# Altium project lga1700.PrjPCB (part 1 of 11)
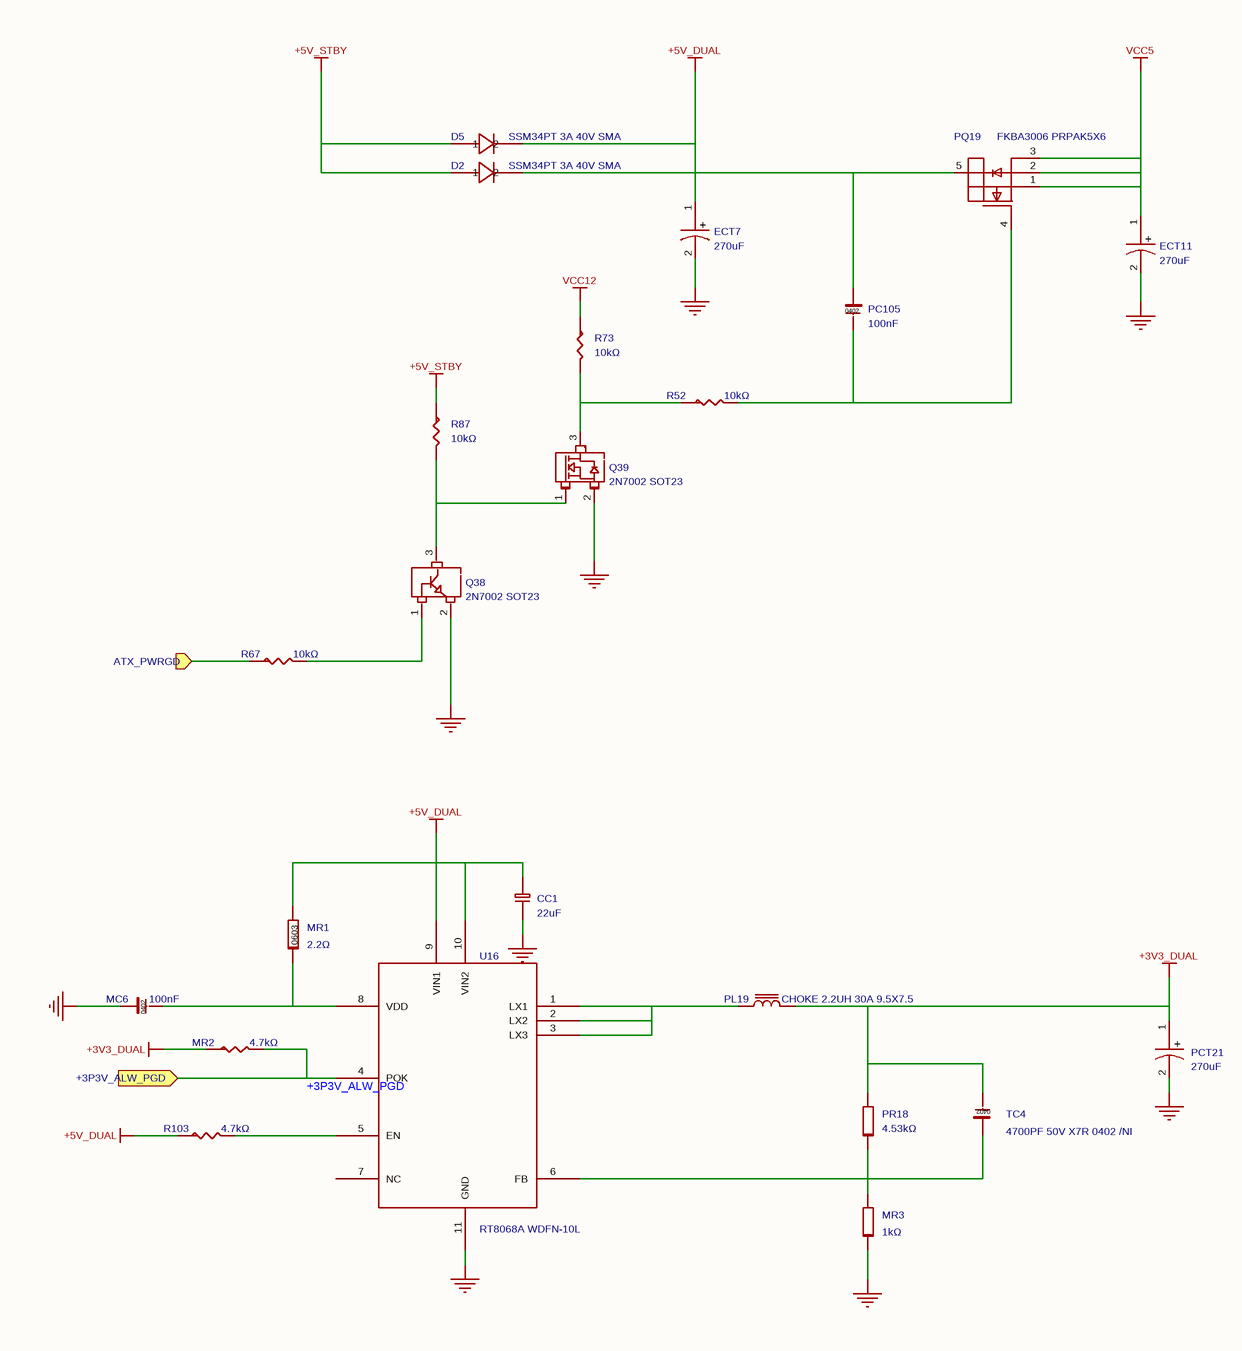
[diagram p0: 5V_DUAL.schdoc]
26 sheets, 863 parts. Net scope: flat (ports and power ports of the same name join across sheets).
Board files: lga1700.pcbdoc, lga1700ascii.pcbdoc
Sheets:
  5V_DUAL.schdoc
  ADL S PCH 600 CLOCK_PCIE.schdoc
  ADL S PCH 600 PWR.schdoc
  ADL S PCH 600 SPI_PM.schdoc
  ADL S PCH 600 STRAP.schdoc
  AUDIO - ALC897_3CH.schdoc
  COM.schdoc
  CPU_PWR - +VCCCORE_1_3.schdoc
  CPU_PWR - +VCCCORE_2_3.schdoc
  CPU_PWR - +VCCCORE_3_3.schdoc
  CPU_PWR - +VCCGT.schdoc
  CPU_PWR - 1.8V_1.05V.schdoc
  CPU_PWR - VCCIN_AUX.schdoc
  DDR4_PWR - +VDDQ_+VTT_+VPP.schdoc
  DDR4_UDIMM CHANNEL-A0.schdoc
  DDR4_UDIMM CHANNEL-B0.schdoc
  DISPLAY - HDMI 2.0.schdoc
  LAN - RTL8111H.schdoc
  M.2_SATA_SLOT.schdoc
  PCH_PWR - 0.82V_1.05V_1.8V.schdoc
  PEG_PCIEX1 SLOT.schdoc
  POWER - SYSTEM POWER.schdoc
  SIO - IT8613E.schdoc
  SIO - IT8784E.schdoc
  USB32 GEN1 5G_FRONT.schdoc
  USB32 GEN1 5G_REAR.schdoc

## Sheet 5V_DUAL.schdoc
size 420 x 297 mm; Symbol: Sheet-Symbol_A2; Company: 嘉立创EDA; Version: V1.0; Page Size: A2; @Project Name: 【全网首发】X86电脑主板_copy; @Page Count: 30; @Update Date: 2025-10-09; @Create Date: 2025-10-09; @Schematic Name: SCHEMATIC1_1; @Page No: 0; @Page Name: 5V_DUAL; Device: Sheet-Symbol_A2; Border: 1; Width: 1655; Height: 1170; Region Start: 1; X Region Count: 6; Y Region Count: 4; Blade Width: 10; Title Block Position: 3

### Parts
CC1  22uF  [C0603_2]
D2  value SSM34PT 3A 40V SMA  [DIODE_1N5817_4148]  (hidden comment: SS34)
D5  value SSM34PT 3A 40V SMA  [DIODE_1N5817_4148]  (hidden comment: SS34)
ECT7  270uF  [EC1P25C_2]
ECT11  270uF  [EC1P25C_2]
MC6  100nF  [C0402_1]
MR1  2.2Ω  [R0603_1]
MR2  4.7kΩ  [R0402_1]
MR3  1kΩ  [R0402]
PC105  100nF  [C0402]
PCT21  270uF  [EC1P25C_2]
PL19  value CHOKE 2.2UH 30A 9.5X7.5  [CHOKE2U8-20A_3P]  (hidden comment: INDUCTOR_1)
PQ19  value FKBA3006 PRPAK5X6  [PRPAK5X6_1]  (hidden comment: PK616BA)
PR18  4.53kΩ  [R0402_2]
Q38  value 2N7002 SOT23  [SOT23_125]  (hidden comment: 2N7002)
Q39  value 2N7002 SOT23  [SOT-23-3_L2.9-W1.3-P1.90-LS2.4-BR]  (hidden comment: 2N7002)
R52  10kΩ  [R0402_1]
R67  10kΩ  [R0402_3]
R73  10kΩ  [R0402_3]
R87  10kΩ  [R0402_3]
R103  4.7kΩ  [R0402_3]
TC4  value 4700PF 50V X7R 0402 /NI  [C0402]  (hidden comment: C0402)
U16  value RT8068A WDFN-10L  [DFN3X3-10-0-5_1]  (hidden comment: RT8068AZQW)

### Ports
+3P3V_ALW_PGD (in), ATX_PWRGD (in)

### Nets
+3V3_DUAL: MR2.1 PCT21.1 PL19.2 PR18.2 TC4.2
+5V_DUAL: CC1.1 D2.2 D5.2 ECT7.1 MR1.2 PC105.1 PQ19.5(DRAIN1) R103.1 U16.9(VIN1) U16.10(VIN2)
+5V_STBY: D2.1 D5.1 R87.1
GND: CC1.2 ECT7.2 ECT11.2 MC6.1 MR3.1 PCT21.2 Q38.2(E) Q39.2(S) U16.11(GND)
VCC5: ECT11.1 PQ19.1(SOURCE1) PQ19.2(SOURCE2) PQ19.3(SOURCE3)
VCC12: R73.1
+3P3V_ALW_PGD: MR2.2 U16.4(POK) ; port +3P3V_ALW_PGD
NetATXPWR1_8: R67.1 ; port ATX_PWRGD
NetMC6_2: MC6.2 MR1.1 U16.8(VDD)
NetMR3_2: MR3.2 PR18.1 TC4.1 U16.6(FB)
NetPC105_2: PC105.2 PQ19.4(GATE) R52.2
NetPL19_1: PL19.1 U16.1(LX1) U16.2(LX2) U16.3(LX3)
NetQ38_1: Q38.1(B) R67.2
NetQ38_3: Q38.3(C) Q39.1(G) R87.2
NetQ39_3: Q39.3(D) R52.1 R73.2
NetR103_2: R103.2 U16.5(EN)

Not connected (* = marked no-connect by the designer): U16 7(NC)

### Notes on the sheet
- 更新日期
- 2025-10-09
- 原理图
- 图页
- SCHEMATIC1_1
- 5V_DUAL
- 创建日期
- 物料编码
- 审阅
- 绘制
- 【全网首发】X86电脑主板_copy
- 版本
- V1.0
- 尺寸
- A2
- 页
- 0
- 嘉立创EDA
- 共
- 30
- 1
- (in symbol 160AREC271M0609) +

### Library data of the parts
CC1 = CL10A226MQ8NRNC_1: 容值:22uF;精度:±20%;额定电压:6.3V;材质(温度系数):X5R;; Manufacturer: SAMSUNG(三星); 3D Model: ac125912035d415993ca9572d50418b1; Symbol: CAP; PCB Footprint: C0603; Tolerance: ±20%; AddInBom: yes; Voltage Rated: 6.3V; ModelName: C0603_L1.6-W0.8-H0.8; ModelTransform: 62.992,31.496,0,0,0,0,0,0,0; Temperature Coefficient: X5R; Device: CL10A226MQ8NRNC_1; Value: 22uF; Supplier: LCSC; Datasheet: https://atta.szlcsc.com/upload/public/pdf/source/20160103/1457707740762.pdf; FootprintName: C0603_2; SupplierPart: C59461; ConvertToPcb: yes; LCSC Part Name: 22uF ±20% 6.3V; JLCPCB Part Class: Basic Part; ManufacturerPart: CL10A226MQ8NRNC; Supplier Footprint: 0603
D2 D5 = SS34_C727060: 二极管配置:独立式;正向压降(Vf):550mV@3A;直流反向耐压(Vr):40V;平均整流电流(Io):3A;; Manufacturer: TWGMC(台湾迪嘉); Symbol: 1N4148_0; AddInBom: yes; ModelId: 5b53cc1b87a148cc9fa13125be89f948; ModelName: SMA_L4.3-W2.5-LS5.0-RD; ModelTransform: 194.8815,98.425,0,0,0,0,0,0,0; Diode Configuration: 独立式; Reverse Voltage (Vr): 40V; Average Rectified Current (Io): 3A; Reverse Leakage Current (Ir): 500uA@40V; Device: SS34_C727060; LCSC Part Name: 电压:40V 电流:3A; SupplierPart: C727060; ManufacturerPart: SS34; Supplier Footprint: SMA(DO-214AC); JLCPCB Part Class: Extended Part; Datasheet: https://atta.szlcsc.com/upload/public/pdf/source/20200828/C727059_6599B6CAC5F3238B9C33E46794659DBE.pdf; Supplier: LCSC; ConvertToPcb: yes; FootprintName: DIODE_1N5817_4148; Forward Voltage (Vf@If): 550mV@3A
ECT7 ECT11 PCT21 = 160AREC271M0609: 容值:270uF;精度:±20%;额定电压:16V;纹波电流:3.8A@100kHz;等效串联电阻:15mΩ@100kHz~300kHz;类型:-;; Manufacturer: APAQ(钰邦); Symbol: CAPACITOR POL_0; AddInBom: yes; ModelId: 0a4db4bf24b443b3be4905be97ff10c5; ModelName: CAP-TH_BD6.3-P2.50-D1.0-FD; ModelTransform: 248.4247,247.99777,0,0,0,0,0,0,-137.795; Tolerance: ±20%; Rated Voltage: 16V; φD: 6.3mm; L: 9mm; Lifetime @ Temp: 2000hrs@105℃; Device: 160AREC271M0609; Value: 270uF; LCSC Part Name: 270uF ±20% 16V; SupplierPart: C176312; ManufacturerPart: 160AREC271M0609; Supplier Footprint: 插件,D6.3xL9mm; JLCPCB Part Class: Extended Part; Datasheet: https://atta.szlcsc.com/upload/public/pdf/source/20180420/C176312_A6CC051F3F5535015096354530D22B11.pdf; Supplier: LCSC; ConvertToPcb: yes; FootprintName: EC1P25C_2; Ripple Current: 3.8A@100kHz; Equivalent Series Resistance(ESR): 15mΩ@100kHz~300kHz; Type: -; Lead Spacing: 2.5mm; Operating Temperature: -55℃~+105℃
MC6 = CL05B104KO5NNNC: 容值:100nF;精度:±10%;额定电压:16V;材质(温度系数):X7R;; Manufacturer: SAMSUNG(三星); Symbol: C0402; ModelId: 36a51122f27c49738f86b3bfa98863e0; Tolerance: ±10%; AddInBom: yes; Voltage Rated: 16V; ModelName: C0402_L1.0-W0.5-H0.5; ModelTransform: 39.37,19.685,0,0,0,0,0,0,0; Temperature Coefficient: X7R; Device: CL05B104KO5NNNC; Value: 100nF; Supplier: LCSC; Datasheet: https://atta.szlcsc.com/upload/public/pdf/source/20160103/1457707674891.pdf; FootprintName: C0402_1; SupplierPart: C1525; ConvertToPcb: yes; LCSC Part Name: 100nF ±10% 16V; JLCPCB Part Class: Basic Part; ManufacturerPart: CL05B104KO5NNNC; Supplier Footprint: 0402
MR1 = 0603WAF220KT5E: 电阻类型:厚膜电阻;阻值:2.2Ω;精度:±1%;功率:100mW;; Manufacturer: UNI-ROYAL(厚声); Symbol: R0603; ModelId: fc143cca1e79419f9cd78b61e9279f08; Tolerance: ±1%; AddInBom: yes; Power(Watts): 100mW; ModelTransform: 31.8897,63.7794,0,90,0,0,0,0,0; Overload Voltage (Max): 75V; Temperature Coefficient: ±400ppm/℃; Device: 0603WAF220KT5E; Value: 2.2Ω; Type: 厚膜电阻; Supplier: LCSC; Datasheet: https://atta.szlcsc.com/upload/public/pdf/source/20200306/C422600_1E6D84923E4A46A82E41ADD87F860B5C.pdf; FootprintName: R0603_1; SupplierPart: C22939; ModelName: R0603; ConvertToPcb: yes; LCSC Part Name: 2.2Ω ±1% 100mW; JLCPCB Part Class: Basic Part; ManufacturerPart: 0603WAF220KT5E; Supplier Footprint: 0603; Operating Temperature Range: -55℃~+155℃
MR2 = 0402WGF4701TCE: 电阻类型:厚膜电阻;阻值:4.7kΩ;精度:±1%;功率:62.5mW;; Manufacturer: UNI-ROYAL(厚声); Symbol: R-0603_0; ModelId: 671aefced39d4c318694bba8bd8efd39; Tolerance: ±1%; AddInBom: yes; Power(Watts): 62.5mW; ModelName: R0402_L1.0-W0.5-H0.5; ModelTransform: 39.37,19.685,0,0,0,0,0,0.0005,0; Overload Voltage (Max): 50V; Temperature Coefficient: ±100ppm/℃; Device: 0402WGF4701TCE; Value: 4.7kΩ; Type: 厚膜电阻; Supplier: LCSC; Datasheet: https://atta.szlcsc.com/upload/public/pdf/source/20200306/C422600_1E6D84923E4A46A82E41ADD87F860B5C.pdf; FootprintName: R0402_1; SupplierPart: C25900; ConvertToPcb: yes; LCSC Part Name: 4.7kΩ ±1% 62.5mW; JLCPCB Part Class: Basic Part; ManufacturerPart: 0402WGF4701TCE; Supplier Footprint: 0402; Operating Temperature Range: -55℃~+155℃
MR3 = 0402WGF1001TCE: 电阻类型:厚膜电阻;阻值:1kΩ;精度:±1%;功率:62.5mW;; Manufacturer: UNI-ROYAL(厚声); ModelId: 671aefced39d4c318694bba8bd8efd39; Tolerance: ±1%; AddInBom: yes; Power(Watts): 62.5mW; ModelName: R0402_L1.0-W0.5-H0.5; ModelTransform: 39.37,19.685,0,0,0,0,0,0.0005,0; Overload Voltage (Max): 50V; Temperature Coefficient: ±100ppm/℃; Device: 0402WGF1001TCE; Symbol: R0402; Value: 1kΩ; Type: 厚膜电阻; Supplier: LCSC; Datasheet: https://atta.szlcsc.com/upload/public/pdf/source/20200306/C422600_1E6D84923E4A46A82E41ADD87F860B5C.pdf; FootprintName: R0402; SupplierPart: C11702; ConvertToPcb: yes; LCSC Part Name: 1kΩ ±1% 62.5mW; JLCPCB Part Class: Basic Part; ManufacturerPart: 0402WGF1001TCE; Supplier Footprint: 0402; Operating Temperature Range: -55℃~+155℃
PC105 = CL05B104KO5NNNC: 容值:100nF;精度:±10%;额定电压:16V;材质(温度系数):X7R;; Manufacturer: SAMSUNG(三星); ModelId: 36a51122f27c49738f86b3bfa98863e0; Tolerance: ±10%; AddInBom: yes; Voltage Rated: 16V; ModelName: C0402_L1.0-W0.5-H0.5; ModelTransform: 39.37,19.685,0,0,0,0,0,0,0; Temperature Coefficient: X7R; Device: CL05B104KO5NNNC; Symbol: C0402; Value: 100nF; Supplier: LCSC; Datasheet: https://atta.szlcsc.com/upload/public/pdf/source/20160103/1457707674891.pdf; FootprintName: C0402; SupplierPart: C1525; ConvertToPcb: yes; LCSC Part Name: 100nF ±10% 16V; JLCPCB Part Class: Basic Part; ManufacturerPart: CL05B104KO5NNNC; Supplier Footprint: 0402
PL19 = INDUCTOR_1: 2R8 一体成型直插电感; Check: false; AddInBom: yes; Device: INDUCTOR_1; Symbol: INDUCTOR_1; FootprintName: CHOKE2U8-20A_3P; ConvertToPcb: yes
PQ19 = PK616BA: 类型:1个N沟道;漏源电压(Vdss):30V;连续漏极电流(Id):50A;功率(Pd):31W;导通电阻(RDS(on)@Vgs,Id):9.5mΩ@4.5V,13A;阈值电压(Vgs(th)@Id):3V@250uA;; Manufacturer: NIKO-SEM(尼克森); Symbol: MOS-N_SO8_1; AddInBom: yes; ModelId: 178189b27e7544aca50c111426555358; ModelName: PDFN-8_L4.9-W5.8-H1.0-P1.27; ModelTransform: 200.787,240.157,0,0,0,0,-0.097,0,0; Drain Source Voltage (Vdss): 30V; Continuous Drain Current (Id): 50A; Power Dissipation (Pd): 31W; Device: PK616BA; LCSC Part Name: 1个N沟道 耐压:30V 电流:50A; SupplierPart: C133608; ManufacturerPart: PK616BA; Supplier Footprint: PDFN-8(5.8x4.9); JLCPCB Part Class: Extended Part; Datasheet: https://atta.szlcsc.com/upload/public/pdf/source/20170930/C133608_1506736454344997453.pdf; Supplier: LCSC; ConvertToPcb: yes; FootprintName: PRPAK5X6_1; Type: 1个N沟道; Drain Source On Resistance (RDS(on)@Vgs,Id): 9.5mΩ@4.5V,13A; Gate Threshold Voltage (Vgs(th)@Id): 3V@250uA
PR18 = RC0402FR-074K53L: 电阻类型:厚膜电阻;阻值:4.53kΩ;精度:±1%;功率:62.5mW;; Manufacturer: YAGEO(国巨); Symbol: R0402; ModelId: 671aefced39d4c318694bba8bd8efd39; Tolerance: ±1%; AddInBom: yes; Power(Watts): 62.5mW; ModelName: R0402_L1.0-W0.5-H0.5; ModelTransform: 39.37,19.685,0,0,0,0,0,0.0005,0; Overload Voltage (Max): 50V; Temperature Coefficient: ±100ppm/℃; Device: RC0402FR-074K53L; Value: 4.53kΩ; Type: 厚膜电阻; Supplier: LCSC; Datasheet: https://atta.szlcsc.com/upload/public/pdf/source/20180904/C276271_6CDD8B95D1A0F3B937C2E6718EE36455.pdf; FootprintName: R0402_2; SupplierPart: C276271; ConvertToPcb: yes; LCSC Part Name: 4.53kΩ ±1% 62.5mW; JLCPCB Part Class: Extended Part; ManufacturerPart: RC0402FR-074K53L; Supplier Footprint: 0402; Operating Temperature Range: -55℃~+155℃
Q38 = 2N7002_C916396: 类型:1个N沟道;漏源电压(Vdss):60V;连续漏极电流(Id):115mA;功率(Pd):200mW;导通电阻(RDS(on)@Vgs,Id):1.2Ω@10V,500mA;阈值电压(Vgs(th)@Id):2.1V@250uA;; Manufacturer: JSMSEMI(杰盛微); Symbol: 2N3904_0; AddInBom: yes; ModelId: c62791f0466c4ae2a892c056b845b0ca; ModelName: SOT-23-3P_L2.9-W1.3-H1.0-LS2.4-P0.95; ModelTransform: 98.425,114.173,0,180,0,0,0.0005,-0.0005,0; Type: 1个N沟道; Drain Source Voltage (Vdss): 60V; Continuous Drain Current (Id): 115mA; Power Dissipation (Pd): 200mW; Input Capacitance (Ciss@Vds): 20pF@25V; Reverse Transfer Capacitance (Crss@Vds): 4pF@25V; Device: 2N7002_C916396; LCSC Part Name: 1个N沟道 耐压:60V 电流:115mA; SupplierPart: C916396; ManufacturerPart: 2N7002; Supplier Footprint: SOT-23; JLCPCB Part Class: Extended Part; Datasheet: https://atta.szlcsc.com/upload/public/pdf/source/20230714/89F30C6A193AD72E5F1F14B53E304F4A.pdf; Supplier: LCSC; ConvertToPcb: yes; FootprintName: SOT23_125; Drain Source On Resistance (RDS(on)@Vgs,Id): 1.2Ω@10V,500mA; Gate Threshold Voltage (Vgs(th)@Id): 2.1V@250uA; Total Gate Charge (Qg@Vgs): -; Operating Temperature: -
Q39 = 2N7002_C8545: 类型:N沟道;漏源电压(Vdss):60V;连续漏极电流(Id):115mA;功率(Pd):200mW;导通电阻(RDS(on)@Vgs,Id):7.5Ω@10V,500mA;阈值电压(Vgs(th)@Id):2.5V@250uA;; Manufacturer: CJ(江苏长电/长晶); Symbol: 2N7002-N_0; Type: N沟道; ModelId: c62791f0466c4ae2a892c056b845b0ca; AddInBom: yes; ModelName: SOT-23-3P_L2.9-W1.3-H1.0-LS2.4-P0.95; ModelTransform: 98.425,114.173,0,180,0,0,0.0005,-0.0005,0; Power Dissipation (Pd): 200mW; Drain Source Voltage (Vdss): 60V; Continuous Drain Current (Id): 115mA; Device: 2N7002_C8545; Supplier: LCSC; Datasheet: https://atta.szlcsc.com/upload/public/pdf/source/20170302/1488422688078.pdf; FootprintName: SOT-23-3_L2.9-W1.3-P1.90-LS2.4-BR; SupplierPart: C8545; ConvertToPcb: yes; LCSC Part Name: N沟道 60V 115mA; JLCPCB Part Class: Basic Part; ManufacturerPart: 2N7002; Supplier Footprint: SOT-23; Gate Threshold Voltage (Vgs(th)@Id): 2.5V@250uA; Drain Source On Resistance (RDS(on)@Vgs,Id): 7.5Ω@10V,500mA
R52 R67 R73 R87 = 0402WGF1002TCE: 电阻类型:厚膜电阻;阻值:10kΩ;精度:±1%;功率:62.5mW;; Manufacturer: UNI-ROYAL(厚声); Symbol: R-0603_0; ModelId: 671aefced39d4c318694bba8bd8efd39; Tolerance: ±1%; AddInBom: yes; Power(Watts): 62.5mW; ModelName: R0402_L1.0-W0.5-H0.5; ModelTransform: 39.37,19.685,0,0,0,0,0,0.0005,0; Overload Voltage (Max): 50V; Temperature Coefficient: ±100ppm/℃; Device: 0402WGF1002TCE; Value: 10kΩ; Type: 厚膜电阻; Supplier: LCSC; Datasheet: https://atta.szlcsc.com/upload/public/pdf/source/20200306/C422600_1E6D84923E4A46A82E41ADD87F860B5C.pdf; SupplierPart: C25744; ConvertToPcb: yes; LCSC Part Name: 10kΩ ±1% 62.5mW; JLCPCB Part Class: Basic Part; ManufacturerPart: 0402WGF1002TCE; Supplier Footprint: 0402; Operating Temperature Range: -55℃~+155℃
  R52: FootprintName: R0402_1
  R67 R73 R87: FootprintName: R0402_3
R103 = 0402WGF4701TCE: 电阻类型:厚膜电阻;阻值:4.7kΩ;精度:±1%;功率:62.5mW;; Manufacturer: UNI-ROYAL(厚声); Symbol: R; ModelId: 671aefced39d4c318694bba8bd8efd39; Tolerance: ±1%; AddInBom: yes; Power(Watts): 62.5mW; ModelName: R0402_L1.0-W0.5-H0.5; ModelTransform: 39.37,19.685,0,0,0,0,0,0.0005,0; Overload Voltage (Max): 50V; Temperature Coefficient: ±100ppm/℃; Device: 0402WGF4701TCE; Value: 4.7kΩ; Type: 厚膜电阻; Supplier: LCSC; Datasheet: https://atta.szlcsc.com/upload/public/pdf/source/20200306/C422600_1E6D84923E4A46A82E41ADD87F860B5C.pdf; FootprintName: R0402_3; SupplierPart: C25900; ConvertToPcb: yes; LCSC Part Name: 4.7kΩ ±1% 62.5mW; JLCPCB Part Class: Basic Part; ManufacturerPart: 0402WGF4701TCE; Supplier Footprint: 0402; Operating Temperature Range: -55℃~+155℃
TC4 = C0402: Manufacturer: FH(风华); Manufacturer Part: 0402B472K500NT; 3D Model Transform: 39.37,19.685,0,0,0,0,0,0,0; Tolerance: ±10%; Voltage Rated: 50V; Temperature Coefficient: X7R; ModelId: 222a10e09e6e477a9f85628e277082cb; AddInBom: yes; Device: C0402; Symbol: C0402; LCSC Part Name: 4.7nF ±10% 50V; Supplier Part: C1538; Supplier Footprint: 0402; JLCPCB Part Class: Basic Part; Datasheet: https://atta.szlcsc.com/upload/public/pdf/source/20200305/C486355_26A10D38EF8C2A5C37091D0039909270.pdf; Supplier: LCSC; FootprintName: C0402; ModelName: C0402; ConvertToPcb: yes
U16 = RT8068AZQW: 功能类型:降压型;输入电压:-;输出电流(最大值):-;; Manufacturer: RICHTEK(立锜); Symbol: uP6305 PSOP8_1; AddInBom: yes; ModelId: fa41748ee6fa4796aafe6110ca106f1f; ModelName: WDFN-10_L3.0-W3.0-H0.8-P0.50; ModelTransform: 118.11,118.8974,0,0,0,0,0,0,0; Function: 降压型; Switch tube (built-in/external): 内置; Device: RT8068AZQW; LCSC Part Name: RT8068AZQW; SupplierPart: C55803; ManufacturerPart: RT8068AZQW; Supplier Footprint: WDFN-10-EP(3x3); JLCPCB Part Class: Extended Part; Datasheet: https://atta.szlcsc.com/upload/public/pdf/source/20171129/C55803_15119540043011151371.pdf; Supplier: LCSC; ConvertToPcb: yes; FootprintName: DFN3X3-10-0-5_1; Input Voltage: -; Output Current (Max): -; Switching Frequency: -; Synchronous Rectification: -; Number of Outputs: -; Topology: -

## Sheet ADL S PCH 600 CLOCK_PCIE.schdoc
size 420 x 298 mm; Symbol: Sheet-Symbol_A3; Company: 嘉立创EDA; Version: V1.0; Page Size: A3; @Project Name: H610(2024/12/09); @Page Count: 36; @Update Date: 2025-10-09; @Create Date: 2025-10-09; @Schematic Name: SCHEMATIC1; @Page No: 9; @Page Name: ADL S PCH 600 CLOCK/PCIE; Device: Sheet-Symbol_A3; @Board Name: SCHEMATIC1; @Create Time: 10:15:40; @Update Time: 10:18:17
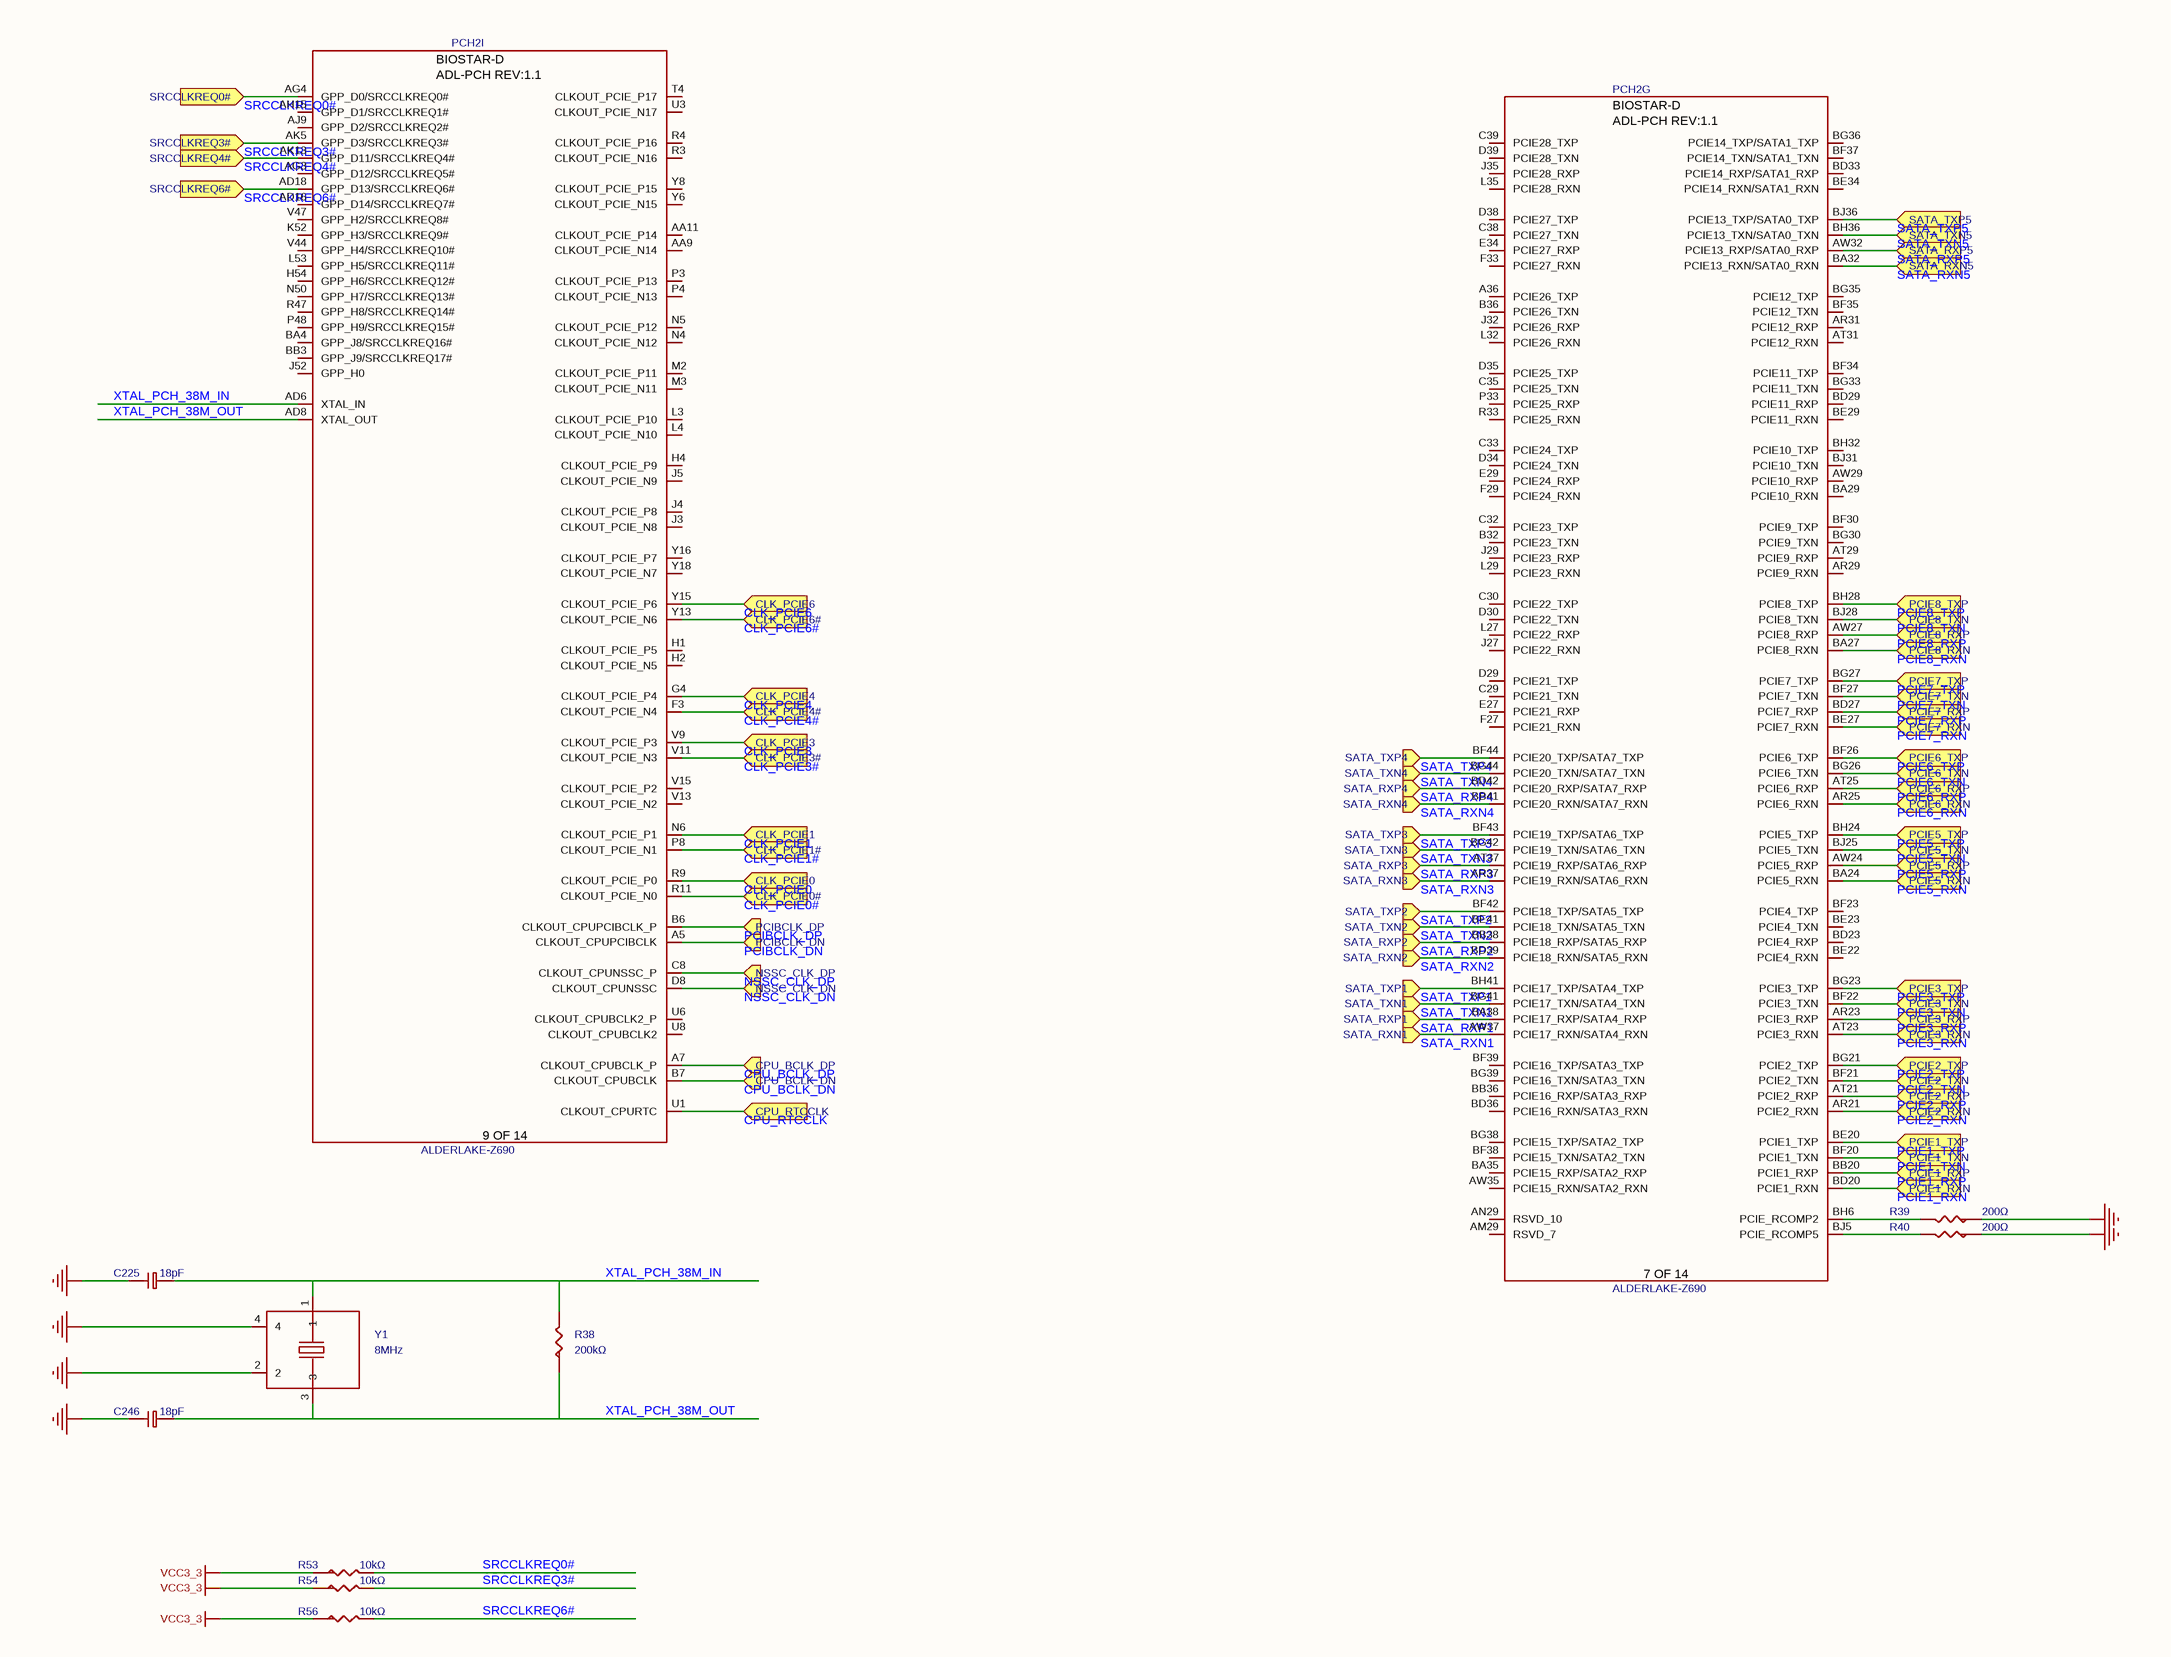
[diagram p1: ADL S PCH 600 CLOCK_PCIE.schdoc]

### Parts
C225  18pF  [C0402_1]
C246  18pF  [C0402_3]
PCH2  value ALDERLAKE-Z690  [BGA1045_28X25MM-ADL]  (hidden comment: ADL_S_PCH_EXT_4)  (parts G,I of 14)
R38  200kΩ  [R0402_1]
R39  200Ω  [R0402_2]
R40  200Ω  [R0402_2]
R53  10kΩ  [R0402_1]
R54  10kΩ  [R0402_1]
R56  10kΩ  [R0402_2]
Y1  8MHz  [SMD3225]

### Ports
CLK_PCIE0 (in), CLK_PCIE0# (in), CLK_PCIE1 (in), CLK_PCIE1# (in), CLK_PCIE3 (in), CLK_PCIE3# (in), CLK_PCIE4 (in), CLK_PCIE4# (in), CLK_PCIE6 (in), CLK_PCIE6# (in), CPU_BCLK_DN (in), CPU_BCLK_DP (in), CPU_RTCCLK (in), NSSC_CLK_DN (in), NSSC_CLK_DP (in), PCIBCLK_DN (in), PCIBCLK_DP (in), PCIE1_RXN (in), PCIE1_RXP (in), PCIE1_TXN (in), PCIE1_TXP (in), PCIE2_RXN (in), PCIE2_RXP (in), PCIE2_TXN (in), PCIE2_TXP (in), PCIE3_RXN (in), PCIE3_RXP (in), PCIE3_TXN (in), PCIE3_TXP (in), PCIE5_RXN (in), PCIE5_RXP (in), PCIE5_TXN (in), PCIE5_TXP (in), PCIE6_RXN (in), PCIE6_RXP (in), PCIE6_TXN (in), PCIE6_TXP (in), PCIE7_RXN (in), PCIE7_RXP (in), PCIE7_TXN (in), PCIE7_TXP (in), PCIE8_RXN (in), PCIE8_RXP (in), PCIE8_TXN (in), PCIE8_TXP (in), SATA_RXN1 (in), SATA_RXN2 (in), SATA_RXN3 (in), SATA_RXN4 (in), SATA_RXN5 (in), SATA_RXP1 (in), SATA_RXP2 (in), SATA_RXP3 (in), SATA_RXP4 (in), SATA_RXP5 (in), SATA_TXN1 (in), SATA_TXN2 (in), SATA_TXN3 (in), SATA_TXN4 (in), SATA_TXN5 (in), SATA_TXP1 (in), SATA_TXP2 (in), SATA_TXP3 (in), SATA_TXP4 (in), SATA_TXP5 (in), SRCCLKREQ0# (in), SRCCLKREQ3# (in), SRCCLKREQ4# (in), SRCCLKREQ6# (in)

### Nets
GND: C225.2 C246.2 R39.1 R40.1 Y1.2 Y1.4
VCC3_3: R53.1 R54.1 R56.1
CLK_PCIE0: PCH2.R9(CLKOUT_PCIE_P0) ; port CLK_PCIE0
CLK_PCIE0#: PCH2.R11(CLKOUT_PCIE_N0) ; port CLK_PCIE0#
CLK_PCIE1: PCH2.N6(CLKOUT_PCIE_P1) ; port CLK_PCIE1
CLK_PCIE1#: PCH2.P8(CLKOUT_PCIE_N1) ; port CLK_PCIE1#
CLK_PCIE3: PCH2.V9(CLKOUT_PCIE_P3) ; port CLK_PCIE3
CLK_PCIE3#: PCH2.V11(CLKOUT_PCIE_N3) ; port CLK_PCIE3#
CLK_PCIE4: PCH2.G4(CLKOUT_PCIE_P4) ; port CLK_PCIE4
CLK_PCIE4#: PCH2.F3(CLKOUT_PCIE_N4) ; port CLK_PCIE4#
CLK_PCIE6: PCH2.Y15(CLKOUT_PCIE_P6) ; port CLK_PCIE6
CLK_PCIE6#: PCH2.Y13(CLKOUT_PCIE_N6) ; port CLK_PCIE6#
CPU_BCLK_DN: PCH2.B7(CLKOUT_CPUBCLK) ; port CPU_BCLK_DN
CPU_BCLK_DP: PCH2.A7(CLKOUT_CPUBCLK_P) ; port CPU_BCLK_DP
CPU_RTCCLK: PCH2.U1(CLKOUT_CPURTC) ; port CPU_RTCCLK
NSSC_CLK_DN: PCH2.D8(CLKOUT_CPUNSSC) ; port NSSC_CLK_DN
NSSC_CLK_DP: PCH2.C8(CLKOUT_CPUNSSC_P) ; port NSSC_CLK_DP
PCIBCLK_DN: PCH2.A5(CLKOUT_CPUPCIBCLK) ; port PCIBCLK_DN
PCIBCLK_DP: PCH2.B6(CLKOUT_CPUPCIBCLK_P) ; port PCIBCLK_DP
PCIE1_RXN: PCH2.BD20(PCIE1_RXN) ; port PCIE1_RXN
PCIE1_RXP: PCH2.BB20(PCIE1_RXP) ; port PCIE1_RXP
PCIE1_TXN: PCH2.BF20(PCIE1_TXN) ; port PCIE1_TXN
PCIE1_TXP: PCH2.BE20(PCIE1_TXP) ; port PCIE1_TXP
PCIE2_RXN: PCH2.AR21(PCIE2_RXN) ; port PCIE2_RXN
PCIE2_RXP: PCH2.AT21(PCIE2_RXP) ; port PCIE2_RXP
PCIE2_TXN: PCH2.BF21(PCIE2_TXN) ; port PCIE2_TXN
PCIE2_TXP: PCH2.BG21(PCIE2_TXP) ; port PCIE2_TXP
PCIE3_RXN: PCH2.AT23(PCIE3_RXN) ; port PCIE3_RXN
PCIE3_RXP: PCH2.AR23(PCIE3_RXP) ; port PCIE3_RXP
PCIE3_TXN: PCH2.BF22(PCIE3_TXN) ; port PCIE3_TXN
PCIE3_TXP: PCH2.BG23(PCIE3_TXP) ; port PCIE3_TXP
PCIE5_RXN: PCH2.BA24(PCIE5_RXN) ; port PCIE5_RXN
PCIE5_RXP: PCH2.AW24(PCIE5_RXP) ; port PCIE5_RXP
PCIE5_TXN: PCH2.BJ25(PCIE5_TXN) ; port PCIE5_TXN
PCIE5_TXP: PCH2.BH24(PCIE5_TXP) ; port PCIE5_TXP
PCIE6_RXN: PCH2.AR25(PCIE6_RXN) ; port PCIE6_RXN
PCIE6_RXP: PCH2.AT25(PCIE6_RXP) ; port PCIE6_RXP
PCIE6_TXN: PCH2.BG26(PCIE6_TXN) ; port PCIE6_TXN
PCIE6_TXP: PCH2.BF26(PCIE6_TXP) ; port PCIE6_TXP
PCIE7_RXN: PCH2.BE27(PCIE7_RXN) ; port PCIE7_RXN
PCIE7_RXP: PCH2.BD27(PCIE7_RXP) ; port PCIE7_RXP
PCIE7_TXN: PCH2.BF27(PCIE7_TXN) ; port PCIE7_TXN
PCIE7_TXP: PCH2.BG27(PCIE7_TXP) ; port PCIE7_TXP
PCIE8_RXN: PCH2.BA27(PCIE8_RXN) ; port PCIE8_RXN
PCIE8_RXP: PCH2.AW27(PCIE8_RXP) ; port PCIE8_RXP
PCIE8_TXN: PCH2.BJ28(PCIE8_TXN) ; port PCIE8_TXN
PCIE8_TXP: PCH2.BH28(PCIE8_TXP) ; port PCIE8_TXP
SATA_RXN1: PCH2.AW37(PCIE17_RXN/SATA4_RXN) ; port SATA_RXN1
SATA_RXN2: PCH2.BD39(PCIE18_RXN/SATA5_RXN) ; port SATA_RXN2
SATA_RXN3: PCH2.AR37(PCIE19_RXN/SATA6_RXN) ; port SATA_RXN3
SATA_RXN4: PCH2.BB41(PCIE20_RXN/SATA7_RXN) ; port SATA_RXN4
SATA_RXN5: PCH2.BA32(PCIE13_RXN/SATA0_RXN) ; port SATA_RXN5
SATA_RXP1: PCH2.BA38(PCIE17_RXP/SATA4_RXP) ; port SATA_RXP1
SATA_RXP2: PCH2.BB38(PCIE18_RXP/SATA5_RXP) ; port SATA_RXP2
SATA_RXP3: PCH2.AT37(PCIE19_RXP/SATA6_RXP) ; port SATA_RXP3
SATA_RXP4: PCH2.BD42(PCIE20_RXP/SATA7_RXP) ; port SATA_RXP4
SATA_RXP5: PCH2.AW32(PCIE13_RXP/SATA0_RXP) ; port SATA_RXP5
SATA_TXN1: PCH2.BG41(PCIE17_TXN/SATA4_TXN) ; port SATA_TXN1
SATA_TXN2: PCH2.BE41(PCIE18_TXN/SATA5_TXN) ; port SATA_TXN2
SATA_TXN3: PCH2.BG42(PCIE19_TXN/SATA6_TXN) ; port SATA_TXN3
SATA_TXN4: PCH2.BG44(PCIE20_TXN/SATA7_TXN) ; port SATA_TXN4
SATA_TXN5: PCH2.BH36(PCIE13_TXN/SATA0_TXN) ; port SATA_TXN5
SATA_TXP1: PCH2.BH41(PCIE17_TXP/SATA4_TXP) ; port SATA_TXP1
SATA_TXP2: PCH2.BF42(PCIE18_TXP/SATA5_TXP) ; port SATA_TXP2
SATA_TXP3: PCH2.BF43(PCIE19_TXP/SATA6_TXP) ; port SATA_TXP3
SATA_TXP4: PCH2.BF44(PCIE20_TXP/SATA7_TXP) ; port SATA_TXP4
SATA_TXP5: PCH2.BJ36(PCIE13_TXP/SATA0_TXP) ; port SATA_TXP5
SRCCLKREQ0#: PCH2.AG4(GPP_D0/SRCCLKREQ0#) R53.2 ; port SRCCLKREQ0#
SRCCLKREQ3#: PCH2.AK5(GPP_D3/SRCCLKREQ3#) R54.2 ; port SRCCLKREQ3#
SRCCLKREQ4#: PCH2.AK13(GPP_D11/SRCCLKREQ4#) ; port SRCCLKREQ4#
SRCCLKREQ6#: PCH2.AD18(GPP_D13/SRCCLKREQ6#) R56.2 ; port SRCCLKREQ6#
XTAL_PCH_38M_IN: C225.1 PCH2.AD6(XTAL_IN) R38.2 Y1.1
XTAL_PCH_38M_OUT: C246.1 PCH2.AD8(XTAL_OUT) R38.1 Y1.3
NetPCH2_BH6: PCH2.BH6(PCIE_RCOMP2) R39.2
NetPCH2_BJ5: PCH2.BJ5(PCIE_RCOMP5) R40.2

Not connected (* = marked no-connect by the designer): PCH2 A36(PCIE26_TXP) AA9(CLKOUT_PCIE_N14) AA11(CLKOUT_PCIE_P14) AD16(GPP_D14/SRCCLKREQ7#) AG3(GPP_D12/SRCCLKREQ5#) AH15(GPP_D1/SRCCLKREQ1#) AJ9(GPP_D2/SRCCLKREQ2#) AM29(RSVD_7) AN29(RSVD_10) AR29(PCIE9_RXN) AR31(PCIE12_RXP) AT29(PCIE9_RXP) AT31(PCIE12_RXN) AW29(PCIE10_RXP) AW35(PCIE15_RXN/SATA2_RXN) B32(PCIE23_TXN) B36(PCIE26_TXN) BA4(GPP_J8/SRCCLKREQ16#) BA29(PCIE10_RXN) BA35(PCIE15_RXP/SATA2_RXP) BB3(GPP_J9/SRCCLKREQ17#) BB36(PCIE16_RXP/SATA3_RXP) BD23(PCIE4_RXP) BD29(PCIE11_RXP) BD33(PCIE14_RXP/SATA1_RXP) BD36(PCIE16_RXN/SATA3_RXN) BE22(PCIE4_RXN) BE23(PCIE4_TXN) BE29(PCIE11_RXN) BE34(PCIE14_RXN/SATA1_RXN) BF23(PCIE4_TXP) BF30(PCIE9_TXP) BF34(PCIE11_TXP) BF35(PCIE12_TXN) BF37(PCIE14_TXN/SATA1_TXN) BF38(PCIE15_TXN/SATA2_TXN) BF39(PCIE16_TXP/SATA3_TXP) BG30(PCIE9_TXN) BG33(PCIE11_TXN) BG35(PCIE12_TXP) BG36(PCIE14_TXP/SATA1_TXP) BG38(PCIE15_TXP/SATA2_TXP) BG39(PCIE16_TXN/SATA3_TXN) BH32(PCIE10_TXP) BJ31(PCIE10_TXN) C29(PCIE21_TXN) C30(PCIE22_TXP) C32(PCIE23_TXP) C33(PCIE24_TXP) C35(PCIE25_TXN) C38(PCIE27_TXN) C39(PCIE28_TXP) D29(PCIE21_TXP) D30(PCIE22_TXN) D34(PCIE24_TXN) D35(PCIE25_TXP) D38(PCIE27_TXP) D39(PCIE28_TXN) E27(PCIE21_RXP) E29(PCIE24_RXP) E34(PCIE27_RXP) F27(PCIE21_RXN) F29(PCIE24_RXN) F33(PCIE27_RXN) H1(CLKOUT_PCIE_P5) H2(CLKOUT_PCIE_N5) H4(CLKOUT_PCIE_P9) H54(GPP_H6/SRCCLKREQ12#) J3(CLKOUT_PCIE_N8) J4(CLKOUT_PCIE_P8) J5(CLKOUT_PCIE_N9) J27(PCIE22_RXN) J29(PCIE23_RXP) J32(PCIE26_RXP) J35(PCIE28_RXP) J52(GPP_H0) K52(GPP_H3/SRCCLKREQ9#) L3(CLKOUT_PCIE_P10) L4(CLKOUT_PCIE_N10) L27(PCIE22_RXP) L29(PCIE23_RXN) L32(PCIE26_RXN) L35(PCIE28_RXN) L53(GPP_H5/SRCCLKREQ11#) M2(CLKOUT_PCIE_P11) M3(CLKOUT_PCIE_N11) N4(CLKOUT_PCIE_N12) N5(CLKOUT_PCIE_P12) N50(GPP_H7/SRCCLKREQ13#) P3(CLKOUT_PCIE_P13) P4(CLKOUT_PCIE_N13) P33(PCIE25_RXP) P48(GPP_H9/SRCCLKREQ15#) R3(CLKOUT_PCIE_N16) R4(CLKOUT_PCIE_P16) R33(PCIE25_RXN) R47(GPP_H8/SRCCLKREQ14#) T4(CLKOUT_PCIE_P17) U3(CLKOUT_PCIE_N17) U6(CLKOUT_CPUBCLK2_P) U8(CLKOUT_CPUBCLK2) V13(CLKOUT_PCIE_N2) V15(CLKOUT_PCIE_P2) V44(GPP_H4/SRCCLKREQ10#) V47(GPP_H2/SRCCLKREQ8#) Y6(CLKOUT_PCIE_N15) Y8(CLKOUT_PCIE_P15) Y16(CLKOUT_PCIE_P7) Y18(CLKOUT_PCIE_N7)

### Notes on the sheet
- 更新日期
- 2025-10-09
- 原理图
- 图页
- SCHEMATIC1
- ADL S PCH 600 CLOCK/PCIE
- 创建日期
- 物料编码
- 审阅
- 绘制
- H610(2024/12/09)
- 版本
- V1.0
- 尺寸
- A3
- 页
- 9
- 嘉立创EDA
- 共
- 36
- (in symbol ADL_S_PCH_EXT_4, part G) BIOSTAR-D; ADL-PCH REV:1.1; 7 OF 14
- (in symbol ADL_S_PCH_EXT_4, part I) BIOSTAR-D; ADL-PCH REV:1.1; 9 OF 14

### Library data of the parts
C225 C246 = CC0402FRNPO9BN180: 容值:18pF;精度:±1%;额定电压:50V;材质(温度系数):NP0;; Manufacturer: YAGEO(国巨); Symbol: CAP; PCB Footprint: C0402; Tolerance: ±1%; AddInBom: yes; ModelId: 36a51122f27c49738f86b3bfa98863e0; ModelName: C0402_L1.0-W0.5-H0.5; ModelTransform: 39.37,19.685,0,0,0,0,0,0,0; Voltage Rated: 50V; Temperature Coefficient: NP0; Device: CC0402FRNPO9BN180; Value: 18pF; LCSC Part Name: 18pF ±1% 50V; SupplierPart: C541431; ManufacturerPart: CC0402FRNPO9BN180; Supplier Footprint: 0402; JLCPCB Part Class: Extended Part; Datasheet: https://atta.szlcsc.com/upload/public/pdf/source/20200615/C541431_FAFCAA54FB89671184DDCAE44D787100.pdf; Supplier: LCSC; ConvertToPcb: yes
  C225: FootprintName: C0402_1
  C246: FootprintName: C0402_3
PCH2 = ADL_S_PCH_EXT_4: H610南桥; Check: false; AddInBom: yes; Device: ADL_S_PCH_EXT_4; Symbol: ADL_S_PCH_EXT_4; FootprintName: BGA1045_28X25MM-ADL; ConvertToPcb: yes
R38 = 0402WGF2003TCE: 电阻类型:厚膜电阻;阻值:200kΩ;精度:±1%;功率:62.5mW;; Manufacturer: UNI-ROYAL(厚声); Symbol: 42A**-F; PCB Footprint: R0402; ModelId: 671aefced39d4c318694bba8bd8efd39; Tolerance: ±1%; AddInBom: yes; Power(Watts): 62.5mW; ModelName: R0402_L1.0-W0.5-H0.5; ModelTransform: 39.37,19.685,0,0,0,0,0,0.0005,0; Overload Voltage (Max): 50V; Temperature Coefficient: ±100ppm/℃; Device: 0402WGF2003TCE; Value: 200kΩ; Type: 厚膜电阻; Supplier: LCSC; Datasheet: https://atta.szlcsc.com/upload/public/pdf/source/20200306/C422600_1E6D84923E4A46A82E41ADD87F860B5C.pdf; FootprintName: R0402_1; SupplierPart: C25764; ConvertToPcb: yes; LCSC Part Name: 200kΩ ±1% 62.5mW; JLCPCB Part Class: Basic Part; ManufacturerPart: 0402WGF2003TCE; Supplier Footprint: 0402; Operating Temperature Range: -55℃~+155℃
R39 R40 = 0402WGF2000TCE: 电阻类型:厚膜电阻;阻值:200Ω;精度:±1%;功率:62.5mW;; Manufacturer: UNI-ROYAL(厚声); Symbol: 42A**-F; PCB Footprint: R0402; ModelId: 671aefced39d4c318694bba8bd8efd39; Tolerance: ±1%; AddInBom: yes; Power(Watts): 62.5mW; ModelName: R0402_L1.0-W0.5-H0.5; ModelTransform: 39.37,19.685,0,0,0,0,0,0.0005,0; Overload Voltage (Max): 50V; Temperature Coefficient: ±100ppm/℃; Device: 0402WGF2000TCE; Value: 200Ω; Type: 厚膜电阻; Supplier: LCSC; Datasheet: https://atta.szlcsc.com/upload/public/pdf/source/20200306/C422600_1E6D84923E4A46A82E41ADD87F860B5C.pdf; FootprintName: R0402_2; SupplierPart: C25087; ConvertToPcb: yes; LCSC Part Name: 200Ω ±1% 62.5mW; JLCPCB Part Class: Basic Part; ManufacturerPart: 0402WGF2000TCE; Supplier Footprint: 0402; Operating Temperature Range: -55℃~+155℃
R53 R54 R56 = 0402WGF1002TCE: 电阻类型:厚膜电阻;阻值:10kΩ;精度:±1%;功率:62.5mW;; Manufacturer: UNI-ROYAL(厚声); Symbol: 42A**-F; PCB Footprint: R0402; ModelId: 671aefced39d4c318694bba8bd8efd39; Tolerance: ±1%; AddInBom: yes; Power(Watts): 62.5mW; ModelName: R0402_L1.0-W0.5-H0.5; ModelTransform: 39.37,19.685,0,0,0,0,0,0.0005,0; Overload Voltage (Max): 50V; Temperature Coefficient: ±100ppm/℃; Device: 0402WGF1002TCE; Value: 10kΩ; Type: 厚膜电阻; Supplier: LCSC; Datasheet: https://atta.szlcsc.com/upload/public/pdf/source/20200306/C422600_1E6D84923E4A46A82E41ADD87F860B5C.pdf; SupplierPart: C25744; ConvertToPcb: yes; LCSC Part Name: 10kΩ ±1% 62.5mW; JLCPCB Part Class: Basic Part; ManufacturerPart: 0402WGF1002TCE; Supplier Footprint: 0402; Operating Temperature Range: -55℃~+155℃
  R53 R54: FootprintName: R0402_1
  R56: FootprintName: R0402_2
Y1 = X32258MOB4SI: 晶振类型:贴片晶振;频率:8MHz;常温频差:±10ppm;外接负载电容:12pF;频率稳定度(全温):±20ppm;; Manufacturer: YXC(扬兴晶振); Symbol: 25M_0; AddInBom: yes; ModelId: ae22b8d143894765bc8100c37cb6356f; ModelName: OSC-SMD_4P-L3.2-W2.5-H1.0; ModelTransform: 125.984,98.425,0,0,0,0,0,0,0; Crystal Type: 贴片晶振; Normal temperature Frequency Tolerance: ±10ppm; External load capacitor: 12pF; Frequency Stability(Full temperature range): ±20ppm; Equivalent Series Resistance (ESR): 150Ω; Device: X32258MOB4SI; Value: 8MHz; JLCPCB Part Class: Extended Part; LCSC Part Name: 8MHz ±10ppm 12pF; SupplierPart: C2682775; ManufacturerPart: X32258MOB4SI; Supplier Footprint: SMD3225-4P; Datasheet: https://atta.szlcsc.com/upload/public/pdf/source/20240329/19D5F850207469550BEB00D7DFEDBC7A.pdf; Supplier: LCSC; ConvertToPcb: yes; FootprintName: SMD3225; Operating Temperature: -40℃~+85℃

## Sheet ADL S PCH 600 PWR.schdoc
size 420 x 298 mm; Symbol: Sheet-Symbol_A3; Company: 嘉立创EDA; Version: V1.0; Page Size: A3; @Project Name: 【全网首发】X86电脑主板_copy; @Page Count: 10; @Update Date: 2025-10-09; @Create Date: 2025-10-09; @Schematic Name: SCHEMATIC1_1; @Page No: 0; @Page Name: ADL S PCH 600 PWR; Device: Sheet-Symbol_A3
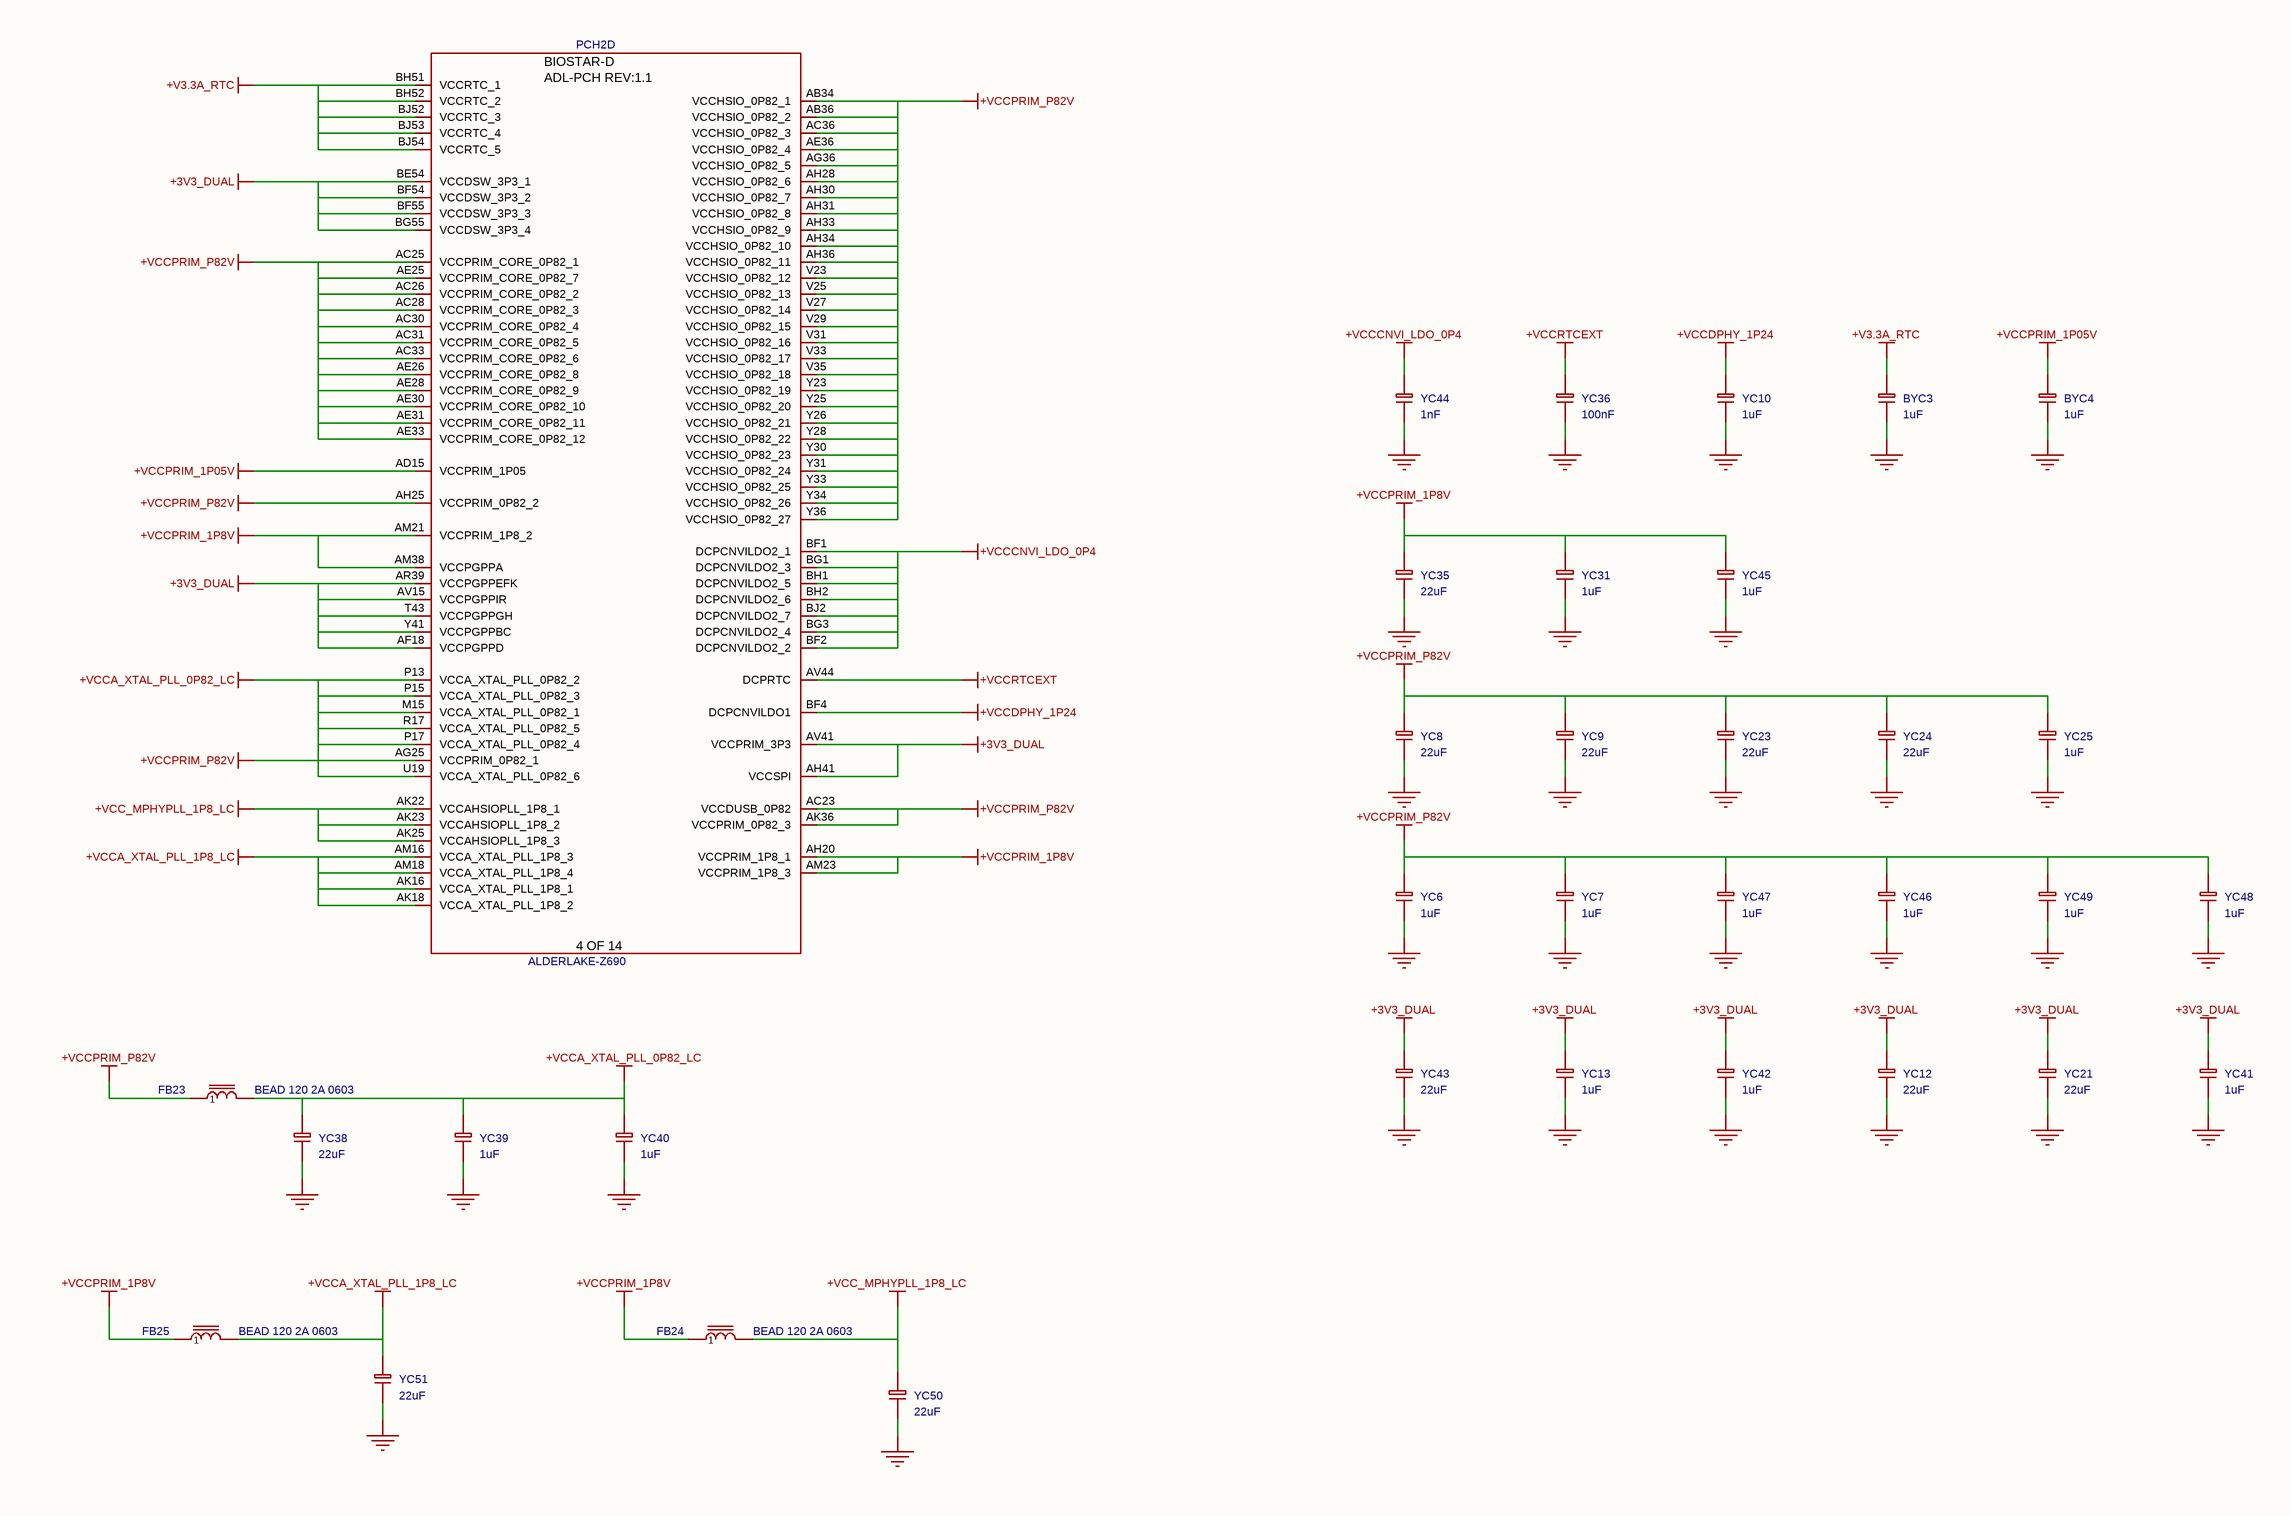
[diagram p2: ADL S PCH 600 PWR.schdoc]

### Parts
BYC3  1uF  [C0402_1]
BYC4  1uF  [C0402]
FB23  value BEAD 120 2A 0603  [FB0603]  (hidden comment: FERRITE BEAD)
FB24  value BEAD 120 2A 0603  [FB0603_2]  (hidden comment: FERRITE BEAD)
FB25  value BEAD 120 2A 0603  [FB0603]  (hidden comment: FERRITE BEAD)
PCH2  value ALDERLAKE-Z690  [BGA1045_28X25MM-ADL]  (hidden comment: ADL_S_PCH_EXT_4)  (part D of 14)
YC6  1uF  [C0402]
YC7  1uF  [C0402_1]
YC8  22uF  [C0603_2]
YC9  22uF  [C0603_2]
YC10  1uF  [C0402_2]
YC12  22uF  [C0603_2]
YC13  1uF  [C0402]
YC21  22uF  [C0603_2]
YC23  22uF  [C0603_1]
YC24  22uF  [C0603_1]
YC25  1uF  [C0402_1]
YC31  1uF  [C0402_3]
YC35  22uF  [C0603_2]
YC36  100nF  [C0402]
YC38  22uF  [C0603_1]
YC39  1uF  [C0402_3]
YC40  1uF  [C0402_3]
YC41  1uF  [C0402_2]
YC42  1uF  [C0402_1]
YC43  22uF  [C0603_2]
YC44  1nF  [C0402_2]
YC45  1uF  [C0402_3]
YC46  1uF  [C0402_2]
YC47  1uF  [C0402]
YC48  1uF  [C0402_1]
YC49  1uF  [C0402_1]
YC50  22uF  [C0603_2]
YC51  22uF  [C0603_2]

### Nets
+3V3_DUAL: PCH2.AF18(VCCPGPPD) PCH2.AH41(VCCSPI) PCH2.AR39(VCCPGPPEFK) PCH2.AV15(VCCPGPPIR) PCH2.AV41(VCCPRIM_3P3) PCH2.BE54(VCCDSW_3P3_1) PCH2.BF54(VCCDSW_3P3_2) PCH2.BF55(VCCDSW_3P3_3) PCH2.BG55(VCCDSW_3P3_4) PCH2.T43(VCCPGPPGH) PCH2.Y41(VCCPGPPBC) YC12.1 YC13.1 YC21.1 YC41.1 YC42.1 YC43.1
+V3.3A_RTC: BYC3.1 PCH2.BH51(VCCRTC_1) PCH2.BH52(VCCRTC_2) PCH2.BJ52(VCCRTC_3) PCH2.BJ53(VCCRTC_4) PCH2.BJ54(VCCRTC_5)
+VCC_MPHYPLL_1P8_LC: FB24.2 PCH2.AK22(VCCAHSIOPLL_1P8_1) PCH2.AK23(VCCAHSIOPLL_1P8_2) PCH2.AK25(VCCAHSIOPLL_1P8_3) YC50.1
+VCCA_XTAL_PLL_0P82_LC: FB23.2 PCH2.M15(VCCA_XTAL_PLL_0P82_1) PCH2.P13(VCCA_XTAL_PLL_0P82_2) PCH2.P15(VCCA_XTAL_PLL_0P82_3) PCH2.P17(VCCA_XTAL_PLL_0P82_4) PCH2.R17(VCCA_XTAL_PLL_0P82_5) PCH2.U19(VCCA_XTAL_PLL_0P82_6) YC38.1 YC39.1 YC40.1
+VCCA_XTAL_PLL_1P8_LC: FB25.2 PCH2.AK16(VCCA_XTAL_PLL_1P8_1) PCH2.AK18(VCCA_XTAL_PLL_1P8_2) PCH2.AM16(VCCA_XTAL_PLL_1P8_3) PCH2.AM18(VCCA_XTAL_PLL_1P8_4) YC51.1
+VCCCNVI_LDO_0P4: PCH2.BF1(DCPCNVILDO2_1) PCH2.BF2(DCPCNVILDO2_2) PCH2.BG1(DCPCNVILDO2_3) PCH2.BG3(DCPCNVILDO2_4) PCH2.BH1(DCPCNVILDO2_5) PCH2.BH2(DCPCNVILDO2_6) PCH2.BJ2(DCPCNVILDO2_7) YC44.1
+VCCDPHY_1P24: PCH2.BF4(DCPCNVILDO1) YC10.1
+VCCPRIM_1P05V: BYC4.1 PCH2.AD15(VCCPRIM_1P05)
+VCCPRIM_1P8V: FB24.1 FB25.1 PCH2.AH20(VCCPRIM_1P8_1) PCH2.AM21(VCCPRIM_1P8_2) PCH2.AM23(VCCPRIM_1P8_3) PCH2.AM38(VCCPGPPA) YC31.1 YC35.1 YC45.1
+VCCPRIM_P82V: FB23.1 PCH2.AB34(VCCHSIO_0P82_1) PCH2.AB36(VCCHSIO_0P82_2) PCH2.AC23(VCCDUSB_0P82) PCH2.AC25(VCCPRIM_CORE_0P82_1) PCH2.AC26(VCCPRIM_CORE_0P82_2) PCH2.AC28(VCCPRIM_CORE_0P82_3) PCH2.AC30(VCCPRIM_CORE_0P82_4) PCH2.AC31(VCCPRIM_CORE_0P82_5) PCH2.AC33(VCCPRIM_CORE_0P82_6) PCH2.AC36(VCCHSIO_0P82_3) PCH2.AE25(VCCPRIM_CORE_0P82_7) PCH2.AE26(VCCPRIM_CORE_0P82_8) PCH2.AE28(VCCPRIM_CORE_0P82_9) PCH2.AE30(VCCPRIM_CORE_0P82_10) PCH2.AE31(VCCPRIM_CORE_0P82_11) PCH2.AE33(VCCPRIM_CORE_0P82_12) PCH2.AE36(VCCHSIO_0P82_4) PCH2.AG25(VCCPRIM_0P82_1) PCH2.AG36(VCCHSIO_0P82_5) PCH2.AH25(VCCPRIM_0P82_2) PCH2.AH28(VCCHSIO_0P82_6) PCH2.AH30(VCCHSIO_0P82_7) PCH2.AH31(VCCHSIO_0P82_8) PCH2.AH33(VCCHSIO_0P82_9) PCH2.AH34(VCCHSIO_0P82_10) PCH2.AH36(VCCHSIO_0P82_11) PCH2.AK36(VCCPRIM_0P82_3) PCH2.V23(VCCHSIO_0P82_12) PCH2.V25(VCCHSIO_0P82_13) PCH2.V27(VCCHSIO_0P82_14) PCH2.V29(VCCHSIO_0P82_15) PCH2.V31(VCCHSIO_0P82_16) PCH2.V33(VCCHSIO_0P82_17) PCH2.V35(VCCHSIO_0P82_18) PCH2.Y23(VCCHSIO_0P82_19) PCH2.Y25(VCCHSIO_0P82_20) PCH2.Y26(VCCHSIO_0P82_21) PCH2.Y28(VCCHSIO_0P82_22) PCH2.Y30(VCCHSIO_0P82_23) PCH2.Y31(VCCHSIO_0P82_24) PCH2.Y33(VCCHSIO_0P82_25) PCH2.Y34(VCCHSIO_0P82_26) PCH2.Y36(VCCHSIO_0P82_27) YC6.1 YC7.1 YC8.1 YC9.1 YC23.1 YC24.1 YC25.1 YC46.1 YC47.1 YC48.1 YC49.1
+VCCRTCEXT: PCH2.AV44(DCPRTC) YC36.1
GND: BYC3.2 BYC4.2 YC6.2 YC7.2 YC8.2 YC9.2 YC10.2 YC12.2 YC13.2 YC21.2 YC23.2 YC24.2 YC25.2 YC31.2 YC35.2 YC36.2 YC38.2 YC39.2 YC40.2 YC41.2 YC42.2 YC43.2 YC44.2 YC45.2 YC46.2 YC47.2 YC48.2 YC49.2 YC50.2 YC51.2

### Notes on the sheet
- 更新日期
- 2025-10-09
- 原理图
- 图页
- SCHEMATIC1_1
- ADL S PCH 600 PWR
- 创建日期
- 物料编码
- 审阅
- 绘制
- 【全网首发】X86电脑主板_copy
- 版本
- V1.0
- 尺寸
- A3
- 页
- 0
- 嘉立创EDA
- 共
- 10
- (in symbol ADL_S_PCH_EXT_4, part D) BIOSTAR-D; ADL-PCH REV:1.1; 4 OF 14

### Library data of the parts
BYC3 YC7 YC10 YC25 YC31 YC39-YC42 YC45 YC46 YC48 YC49 = CL05A105KA5NQNC: 容值:1uF;精度:±10%;额定电压:25V;材质(温度系数):X5R;; Manufacturer: SAMSUNG(三星); Symbol: CAP; PCB Footprint: C0402; Tolerance: ±10%; ModelId: 36a51122f27c49738f86b3bfa98863e0; AddInBom: yes; Voltage Rated: 25V; ModelName: C0402_L1.0-W0.5-H0.5; ModelTransform: 39.37,19.685,0,0,0,0,0,0,0; Temperature Coefficient: X5R; Device: CL05A105KA5NQNC; Value: 1uF; Supplier: LCSC; Datasheet: https://atta.szlcsc.com/upload/public/pdf/source/20160103/1457707735223.pdf; SupplierPart: C52923; ConvertToPcb: yes; LCSC Part Name: 1uF ±10% 25V; JLCPCB Part Class: Basic Part; ManufacturerPart: CL05A105KA5NQNC; Supplier Footprint: 0402
  BYC3 YC7 YC25 YC42 YC48 YC49: FootprintName: C0402_1
  YC10 YC41 YC46: FootprintName: C0402_2
  YC31 YC39 YC40 YC45: FootprintName: C0402_3
BYC4 YC6 YC13 YC47 = CL05A105KA5NQNC: 容值:1uF;精度:±10%;额定电压:25V;材质(温度系数):X5R;; Manufacturer: SAMSUNG(三星); Symbol: CAP; Tolerance: ±10%; ModelId: 36a51122f27c49738f86b3bfa98863e0; AddInBom: yes; Voltage Rated: 25V; ModelName: C0402_L1.0-W0.5-H0.5; ModelTransform: 39.37,19.685,0,0,0,0,0,0,0; Temperature Coefficient: X5R; Device: CL05A105KA5NQNC; PCB Footprint: C0402; Value: 1uF; Supplier: LCSC; Datasheet: https://atta.szlcsc.com/upload/public/pdf/source/20160103/1457707735223.pdf; FootprintName: C0402; SupplierPart: C52923; ConvertToPcb: yes; LCSC Part Name: 1uF ±10% 25V; JLCPCB Part Class: Basic Part; ManufacturerPart: CL05A105KA5NQNC; Supplier Footprint: 0402
FB23 FB25 = FERRITE BEAD_1: Check: false; AddInBom: yes; Device: FERRITE BEAD_1; Symbol: FERRITE BEAD; FootprintName: FB0603; ConvertToPcb: yes
FB24 = FERRITE BEAD: Check: false; AddInBom: yes; Device: FERRITE BEAD; Symbol: FERRITE BEAD; FootprintName: FB0603_2; ConvertToPcb: yes
PCH2 = ADL_S_PCH_EXT_4: AddInBom: yes; Device: ADL_S_PCH_EXT_4; Symbol: ADL_S_PCH_EXT_4; FootprintName: BGA1045_28X25MM-ADL; ConvertToPcb: yes
YC8 YC9 YC12 YC21 YC23 YC24 YC35 YC38 YC43 YC50 YC51 = CL10A226MQ8NRNC_1: 容值:22uF;精度:±20%;额定电压:6.3V;材质(温度系数):X5R;; Manufacturer: SAMSUNG(三星); Symbol: CAP; PCB Footprint: C0603; Tolerance: ±20%; ModelId: ac125912035d415993ca9572d50418b1; AddInBom: yes; Voltage Rated: 6.3V; ModelName: C0603_L1.6-W0.8-H0.8; ModelTransform: 62.992,31.496,0,0,0,0,0,0,0; Temperature Coefficient: X5R; Device: CL10A226MQ8NRNC_1; Value: 22uF; Supplier: LCSC; Datasheet: https://atta.szlcsc.com/upload/public/pdf/source/20160103/1457707740762.pdf; SupplierPart: C59461; ConvertToPcb: yes; LCSC Part Name: 22uF ±20% 6.3V; JLCPCB Part Class: Basic Part; ManufacturerPart: CL10A226MQ8NRNC; Supplier Footprint: 0603
  YC8 YC9 YC12 YC21 YC35 YC43 YC50 YC51: FootprintName: C0603_2
  YC23 YC24 YC38: FootprintName: C0603_1
YC36 = CL05B104KO5NNNC: 容值:100nF;精度:±10%;额定电压:16V;材质(温度系数):X7R;; Manufacturer: SAMSUNG(三星); Symbol: CAP; Tolerance: ±10%; ModelId: 36a51122f27c49738f86b3bfa98863e0; AddInBom: yes; Voltage Rated: 16V; ModelName: C0402_L1.0-W0.5-H0.5; ModelTransform: 39.37,19.685,0,0,0,0,0,0,0; Temperature Coefficient: X7R; Device: CL05B104KO5NNNC; PCB Footprint: C0402; Value: 100nF; Supplier: LCSC; Datasheet: https://atta.szlcsc.com/upload/public/pdf/source/20160103/1457707674891.pdf; FootprintName: C0402; SupplierPart: C1525; ConvertToPcb: yes; LCSC Part Name: 100nF ±10% 16V; JLCPCB Part Class: Basic Part; ManufacturerPart: CL05B104KO5NNNC; Supplier Footprint: 0402
YC44 = 0402B102K500NT: 容值:1nF;精度:±10%;额定电压:50V;材质(温度系数):X7R;; Manufacturer: FH(风华); 3D Model: 36a51122f27c49738f86b3bfa98863e0; Symbol: CAP; PCB Footprint: C0402; Tolerance: ±10%; AddInBom: yes; Voltage Rated: 50V; ModelName: C0402_L1.0-W0.5-H0.5; ModelTransform: 39.37,19.685,0,0,0,0,0,0,0; Temperature Coefficient: X7R; Device: 0402B102K500NT; Value: 1nF; Supplier: LCSC; Datasheet: https://atta.szlcsc.com/upload/public/pdf/source/20200305/C486355_26A10D38EF8C2A5C37091D0039909270.pdf; FootprintName: C0402_2; SupplierPart: C1523; ConvertToPcb: yes; LCSC Part Name: 1nF ±10% 50V; JLCPCB Part Class: Basic Part; ManufacturerPart: 0402B102K500NT; Supplier Footprint: 0402